# Altium schematic sheet Battery_Management_Section.SchDoc
size A; DocumentNumber: 3; SheetNumber: 3; SheetTotal: 13
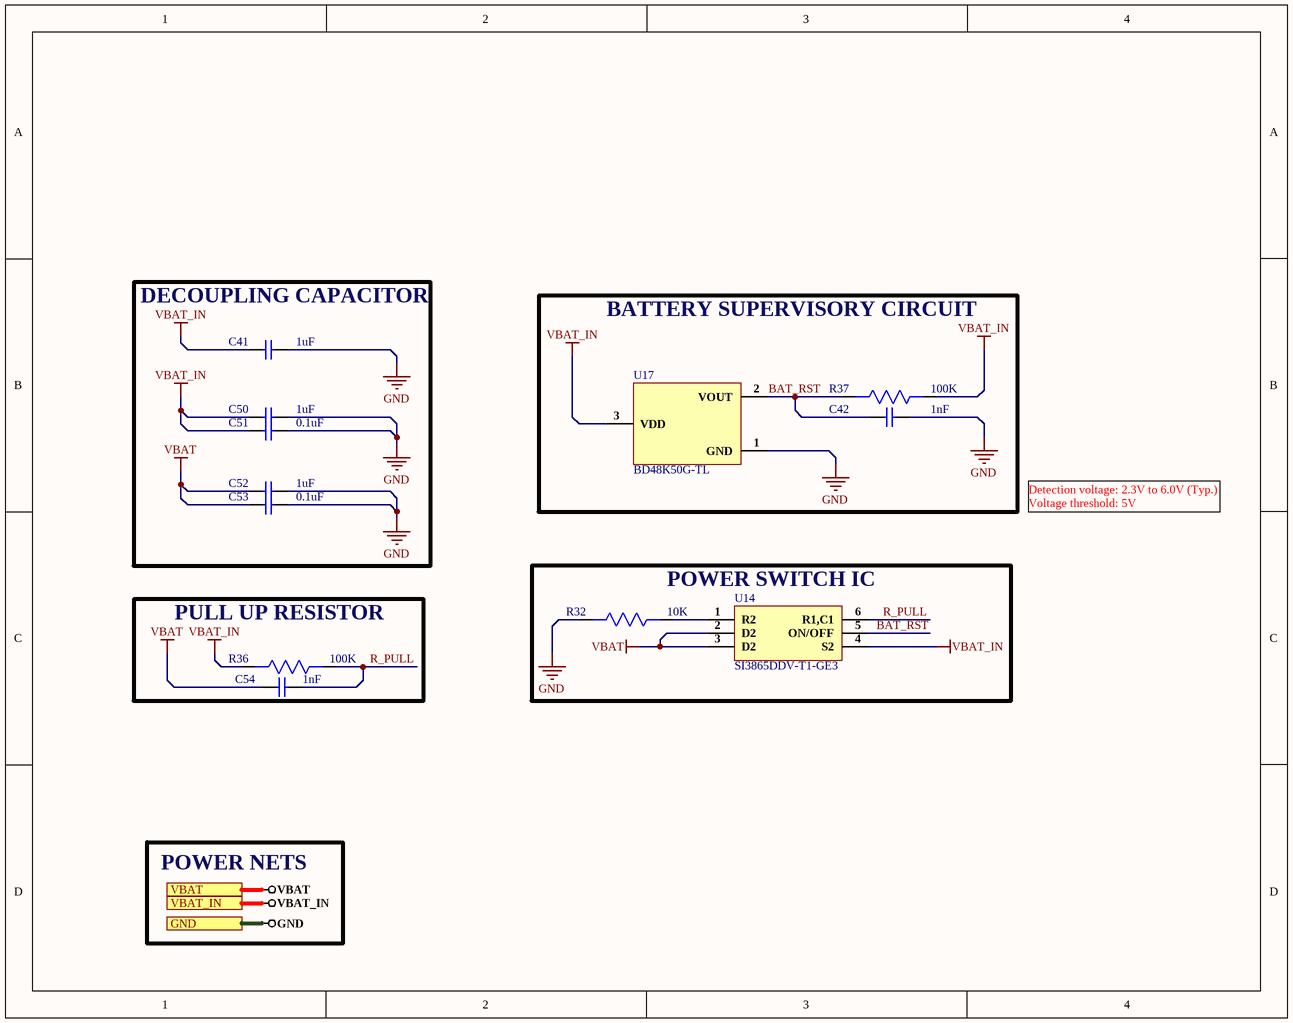
[diagram p0: Battery_Management_Section.SchDoc]

## Parts
C41  1uF  [CAP-0603]
C42  1nF  [CAP-0603]
C50  1uF  [CAP-0603]
C51  0.1uF  [CAP-0603]
C52  1uF  [CAP-0603]
C53  0.1uF  [CAP-0603]
C54  1nF  [CAP-0603]
R32  10K  [RES-0603]
R36  100K  [RES-0603]
R37  100K  [RES-0603]
U14  SI3865DDV-T1-GE3  [6-TSOP]
U17  BD48K50G-TL  [SSOP-3]

## Blocks framed on the sheet
DECOUPLING CAPACITOR: C41 C50-C53
BATTERY SUPERVISORY CIRCUIT: C42 R37 U17
PULL UP RESISTOR: C54 R36
POWER SWITCH IC: R32 U14

## Ports
GND, VBAT, VBAT_IN

## Nets
GND: C41.2 C42.2 C50.2 C51.2 C52.2 C53.2 R32.2 U17.1(GND) ; port GND
VBAT: C52.1 C53.1 C54.1 U14.2(D2) U14.3(D2) ; port VBAT
VBAT_IN: C41.1 C50.1 C51.1 R36.2 R37.1 U14.4(S2) U17.3(VDD) ; port VBAT_IN
BAT_RST: C42.1 R37.2 U14.5(ON/OFF) U17.2(VOUT)
R_PULL: C54.2 R36.1 U14.6(R1,C1)
NetR32_1: R32.1 U14.1(R2)

## Notes on the sheet
- Detection voltage: 2.3V to 6.0V (Typ.)
  Voltage threshold: 5V
- POWER NETS

## Library data of the parts
C41 C50 C52 = CL10A105KA8NNNC: CAP CER 1UF 25V X5R 0603; Manufacturer: Sams; Tolerance: 10%; Supplier 1: Digi-Key; Manufacturer Part Number: CL10A105KA8NNNC; Stock 1: 2768758; Pricing 1: 1=0.1, 10=0.036, 50=0.0198, 100=0.0161, 500=0.01152, 1000=0.00904 (USD); Mount: Surface Mount; Case/Package: 0603; Min Operating Temperature: -55°C; Max Operating Temperature: 85°C; Capacitance: 1uF; Dielectric: X5R; Voltage Rating (DC): 25V; Voltage: 25V; Length: 1.6mm; Height: 0.8mm; Depth: 0.8mm; Lead Free: Lead Free; Supplier Part Number 1: 1276-1102-1-ND
C42 C54 = CC0603JRNPO8BN102: CAP CER 1000PF 25V C0G/NPO 0603; Manufacturer: Yageo; Tolerance: 5%; Dielectric: C0G; Supplier 1: Digi-Key; Manufacturer Part Number: CC0603JRNPO8BN102; Stock 1: 290818; Pricing 1: 1=0.1, 10=0.072, 50=0.0394, 100=0.0322, 500=0.02298, 1000=0.01806 (USD); Mount: Surface Mount; Case/Package: 0603; Case Code (Metric): 1608; Case Code (Imperial): 0603; Min Operating Temperature: -55°C; Max Operating Temperature: 125°C; Capacitance: 1nF; Voltage Rating: 25V; Packaging: Tape and Reel; Package Quantity: 1; Termination: SMD/SMT; Voltage Rating (DC): 25V; Series: CC; Construction: Flat; Length: 1.6mm; Width: 0.031inch; Height: 0.8mm; Thickness: 0.035inch; Depth: 0.8mm; Radiation Hardening: No; REACH SVHC: Unknown; Lead Free: Lead Free; RoHS Compliant: Yes; ComponentLink1URL: http://www.farnell.com/datasheets/1132289.pdf?src-supplier=Element14; ComponentLink1Description: http://www.farnell.com/datasheets/1132289.pdf?src-supplier=Element14; ComponentLink2URL: http://www.farnell.com/datasheets/2213336.pdf?src-supplier=Element14; ComponentLink2Description: http://www.farnell.com/datasheets/2213336.pdf?src-supplier=Element14; ComponentLink3URL: http://www.yageo.com/documents/recent/UPY-GP_NP0_16V-to-50V_16.pdf?src-supplier=Digi-Key; ComponentLink3Description: http://www.yageo.com/documents/recent/UPY-GP_NP0_16V-to-50V_16.pdf?src-supplier=Digi-Key; ComponentLink4URL: http://www.yageo.com/exep/pages/download/literatures/ProductSelectionGuide%202014_Final_2.pdf?src-supplier=Digi-Key; ComponentLink4Description: http://www.yageo.com/exep/pages/download/literatures/ProductSelectionGuide%202014_Final_2.pdf?src-supplier=Digi-Key; ComponentLink5URL: http://www.yageo.com/documents/recent/UPY-GP_NP0_16V-to-50V_8.pdf?src-supplier=Avnet; ComponentLink5Description: http://www.yageo.com/documents/recent/UPY-GP_NP0_16V-to-50V_8.pdf?src-supplier=Avnet; ComponentLink6URL: https://www.verical.com/server-webapp/html/getDatasheet?partID=403523&src-supplier=Verical; ComponentLink6Description: https://www.verical.com/server-webapp/html/getDatasheet?partID=403523&src-supplier=Verical; ComponentLink7URL: http://www.yageo.com/documents/recent/UPY-GP_NP0_16V-to-50V_8.pdf?src-supplier=Avnet+Europe; ComponentLink7Description: http://www.yageo.com/documents/recent/UPY-GP_NP0_16V-to-50V_8.pdf?src-supplier=Avnet+Europe; Supplier Part Number 1: 311-1342-1-ND
C51 C53 = CL10B104KB8NNNL: CAP CER 0.1UF 50V X7R 0603; Manufacturer: Samsung; Capacitance: 100nF; Tolerance: 10%; Supplier 1: Digi-Key; Manufacturer Part Number: CL10B104KB8NNNL; Stock 1: 3731229; Pricing 1: 1=0.1, 10=0.03, 50=0.0164, 100=0.0134, 500=0.00958, 1000=0.00753, 2500=0.00684, 5000=0.0063 (USD); Mount: Surface Mount; Case/Package: 0603; Min Operating Temperature: -55°C; Max Operating Temperature: 125°C; Dielectric: X7R; Packaging: Tape and Reel; Package Quantity: 15000; Voltage Rating: 50V; Voltage Rating (DC): 50V; Series: CL; Construction: Flat; Length: 1.6mm; Width: 0.031inch; Height: 0.8mm; Thickness: 0.035inch; Depth: 0.8mm; Radiation Hardening: No; RoHS Compliant: Yes; ComponentLink1URL: https://www.verical.com/server-webapp/html/getDatasheet?partID=357523&src-supplier=Verical; ComponentLink1Description: https://www.verical.com/server-webapp/html/getDatasheet?partID=357523&src-supplier=Verical; ComponentLink2URL: https://media.digikey.com/pdf/Data%20Sheets/Samsung%20PDFs/CL_Series_MLCC_ds.pdf?src-supplier=Digi-Key; ComponentLink2Description: https://media.digikey.com/pdf/Data%20Sheets/Samsung%20PDFs/CL_Series_MLCC_ds.pdf?src-supplier=Digi-Key; Supplier Part Number 1: 1276-CL10B104KB8NNNLCT-ND
R32 = CRGH0603J10K: RES SMD 10K OHM 5% 1/5W 0603; Manufacturer: TE Connectivity Holsworthy; Resistance: 10kR; Temperature Coefficient: 100ppm/°C; Power Rating: 200mW; Voltage Rating: 50V; Number of Resistors: 1; ComponentLink1URL: http://www.farnell.com/datasheets/2167052.pdf?src-supplier=Element14; ComponentLink1Description: http://www.farnell.com/datasheets/2167052.pdf?src-supplier=Element14; ComponentLink2URL: https://www.rohm.com/datasheet/ESR01MZPF/esr-e?src-supplier=Digi-Key; ComponentLink2Description: https://www.rohm.com/datasheet/ESR01MZPF/esr-e?src-supplier=Digi-Key; Supplier 1: Digi-Key; Manufacturer Part Number: CRGH0603J10K; Stock 1: 85818; Pricing 1: 1=0.1, 10=0.049, 100=0.02, 1000=0.00899, 2500=0.0078 (USD); Mount: Surface Mount; Case/Package: 0603; Case Code (Imperial): 0603; Case Code (Metric): 1608; Min Operating Temperature: -55°C; Max Operating Temperature: 125°C; Tolerance: 5%; Packaging: Tape and Reel; Resistor Type: Thick Film,Power resistor; Number of Terminations: 2; Series: CRGH; Termination: Solder; Voltage Rating (DC): 50V; Resistance Tolerance: 5%; Technology: THICK FILM; Length: 1.6mm; Width: 0.8mm; Height: 0.45mm; Depth: 0.8mm; RoHS Compliant: Yes; REACH SVHC: No SVHC; ELV: Compliant; ComponentLink3URL: http://www.farnell.com/datasheets/2007183.pdf?src-supplier=Element14; ComponentLink3Description: http://www.farnell.com/datasheets/2007183.pdf?src-supplier=Element14; Supplier Part Number 1: A126394DKR-ND
R36 R37 = CRGH0603J100K: RES SMD 100K OHM 5% 1/5W 0603; Manufacturer: TE Connectivity; Resistance: 100kR; Temperature Coefficient: 100ppm/°C; Power Rating: 200mW; Voltage Rating: 50V; Number of Resistors: 1; Supplier 1: Digi-Key; Manufacturer Part Number: CRGH0603J100K; Stock 1: 23277; Pricing 1: 1=0.1, 10=0.049, 100=0.02, 1000=0.00899, 2500=0.0078 (USD); Mount: Surface Mount; Case/Package: 0603; Case Code (Imperial): 0603; Case Code (Metric): 1608; Min Operating Temperature: -55°C; Max Operating Temperature: 125°C; Tolerance: 5%; Packaging: Tape and Reel; Resistor Type: Thick Film,Power resistor; Number of Terminations: 2; Series: CRGH; Termination: Solder; Voltage Rating (DC): 50V; Resistance Tolerance: 5%; Technology: THICK FILM; Length: 1.6mm; Width: 0.8mm; Height: 0.45mm; Depth: 0.8mm; RoHS Compliant: Yes; REACH SVHC: No SVHC; ELV: Compliant; ComponentLink1URL: http://www.farnell.com/datasheets/2007183.pdf?src-supplier=Element14; ComponentLink1Description: http://www.farnell.com/datasheets/2007183.pdf?src-supplier=Element14; Supplier Part Number 1: A126393DKR-ND
U14 = SI3865DDV-T1-GE3: IC PWR SWITCH P-CHAN 1:1 6TSOP; Manufacturer: Vishay; Output Current: 1A; Number of Outputs: 1; Max Power Dissipation: 830mW; Max Supply Voltage: 12V; Min Supply Voltage: 1.5V; Interface: On/Off; Max Output Current: 2.8A; On-State Resistance: 165mR; Output Configuration: High Side; On-state Resistance-Max: 54mR; Supplier 1: Digi-Key; Manufacturer Part Number: SI3865DDV-T1-GE3; Stock 1: 54870; Pricing 1: 1=0.58, 10=0.494, 25=0.462, 100=0.3432, 500=0.26796, 1000=0.2178 (USD); Mount: Surface Mount; Case/Package: TSOP; Number of Pins: 6; Weight: 0.000705oz; Min Operating Temperature: -55°C; Max Operating Temperature: 150°C; Packaging: Tape and Reel; Package Quantity: 3000; Power Dissipation: 830mW; Current Rating: 2.8A; Series: TrenchFET®; Rated Current-Max: 2.8A; Length: 3.1mm; Width: 1.7mm; Height: 1mm; Radiation Hardening: No; REACH SVHC: No SVHC; Lead Free: Lead Free; RoHS Compliant: Yes; ComponentLink1URL: http://www.mouser.com/ds/2/427/si3865ddv-256526.pdf?src-supplier=Mouser; ComponentLink1Description: http://www.mouser.com/ds/2/427/si3865ddv-256526.pdf?src-supplier=Mouser; ComponentLink2URL: http://www.vishay.com/docs/67998/si3865ddv.pdf?src-supplier=Avnet; ComponentLink2Description: http://www.vishay.com/docs/67998/si3865ddv.pdf?src-supplier=Avnet; ComponentLink3URL: https://www.verical.com/server-webapp/html/getDatasheet?partID=710254&src-supplier=Verical; ComponentLink3Description: https://www.verical.com/server-webapp/html/getDatasheet?partID=710254&src-supplier=Verical; ComponentLink4URL: https://media.digikey.com/pdf/Data%20Sheets/Vishay%20Siliconix%20PDFs/Si3865DDV.pdf?src-supplier=Digi-Key; ComponentLink4Description: https://media.digikey.com/pdf/Data%20Sheets/Vishay%20Siliconix%20PDFs/Si3865DDV.pdf?src-supplier=Digi-Key; Supplier Part Number 1: SI3865DDV-T1-GE3CT-ND
U17 = BD48K50G-TL: IC SUPERVISOR 1 CHANNEL 3SSOP; Manufacturer: Rohm; Max Supply Voltage: 6V; Min Supply Voltage: 2.3V; Number of Voltages Monitored: 1; Reset: Active Low; Threshold Voltage: 5V; Accuracy: 1%; Operating Supply Current: 900nA; Supplier 1: Digi-Key; Manufacturer Part Number: BD48K50G-TL; RoHS: Yes; Category: Voltage Supervisors; Stock 1: 3673; Pricing 1: 1=0.48000, 10=0.39000, 25=0.35680, 100=0.26560, 250=0.24068, 500=0.19920, 1000=0.14940 (USD); Mount: Surface Mount; Case/Package: TO-236-3; Number of Pins: 3; Min Operating Temperature: -40°C; Max Operating Temperature: 105°C; Package Quantity: 3000; Packaging: Tape and Reel; Number of Monitored Inputs: 1; Type: Simple Reset/Power-On Reset; Series: BD48xxx; Lead Free: Lead Free; RoHS Compliant: Yes; ComponentLink1URL: https://datasheet.ciiva.com/15105/getdatasheetpartid-705737-15105785.pdf?src-supplier=Verical; ComponentLink1Description: https://datasheet.ciiva.com/15105/getdatasheetpartid-705737-15105785.pdf?src-supplier=Verical; ComponentLink2URL: https://datasheet.ciiva.com/6602/bd48xxg-e-6602101.pdf?src-supplier=Digi-Key; ComponentLink2Description: https://datasheet.ciiva.com/6602/bd48xxg-e-6602101.pdf?src-supplier=Digi-Key; Supplier Part Number 1: BD48K50G-TLCT-ND